# Altium schematic sheet U_Interfaces_Connectors.SchDoc
size A4; SheetNumber: 7; SheetTotal: 9
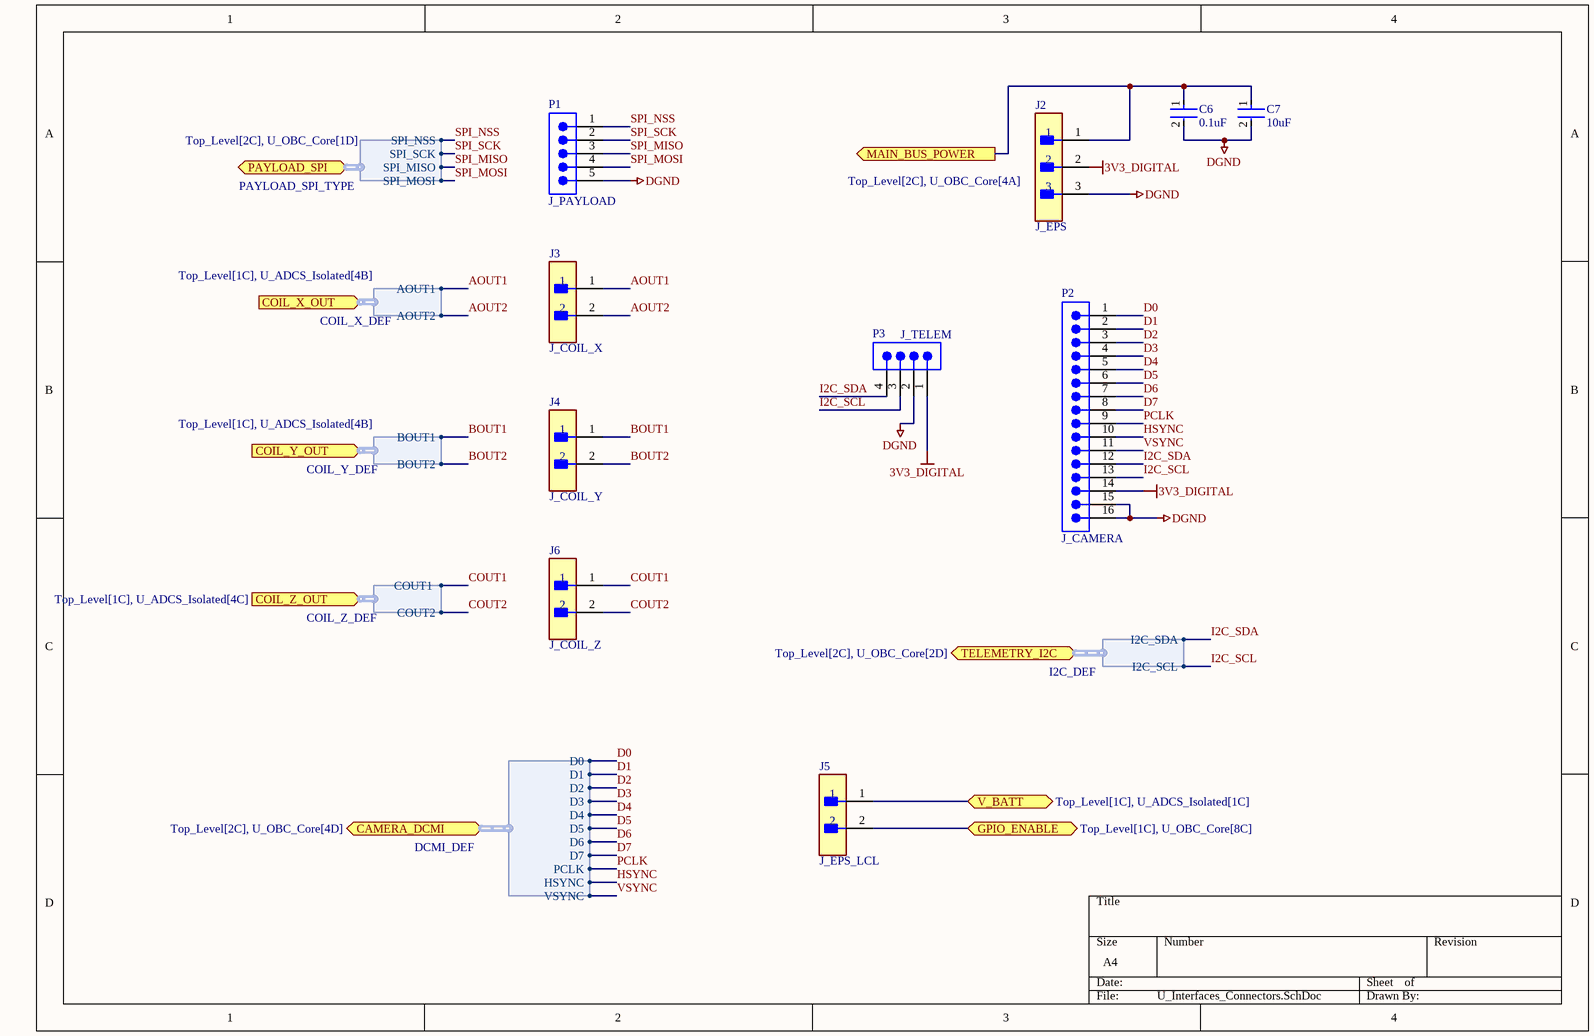
[diagram p0: U_Interfaces_Connectors.SchDoc]

## Parts
C6  0.1uF  [FP-CC0603-DA-MFG]
C7  10uF  [FP-CC0805-0_2-1_45-IPC_A]
J2  J_EPS  [FP-TSW-103-22-G-S-MFG]
J3  J_COIL_X  [FP-TSW-102-22-G-S-MFG]
J4  J_COIL_Y  [FP-TSW-102-22-G-S-MFG]
J5  J_EPS_LCL  [FP-TSW-102-22-G-S-MFG]
J6  J_COIL_Z  [FP-TSW-102-22-G-S-MFG]
P1  J_PAYLOAD  [SMTC-TSW-105-05-X-S]
P2  J_CAMERA  [SMTC-MTLW-116-07-X-S-265]
P3  J_TELEM  [SMTC-TSW-104-08-X-S]

## Ports
CAMERA_DCMI (bidir, harness DCMI_DEF, see Top_Level[2C], U_OBC_Core[4D]), COIL_X_OUT (in, harness COIL_X_DEF, see Top_Level[1C], U_ADCS_Isolated[4B]), COIL_Y_OUT (in, harness COIL_Y_DEF, see Top_Level[1C], U_ADCS_Isolated[4B]), COIL_Z_OUT (in, harness COIL_Z_DEF, see Top_Level[1C], U_ADCS_Isolated[4C]), GPIO_ENABLE (bidir, see Top_Level[1C], U_OBC_Core[8C]), MAIN_BUS_POWER (out, see Top_Level[2C], U_OBC_Core[4A]), PAYLOAD_SPI (bidir, harness PAYLOAD_SPI_TYPE, see Top_Level[2C], U_OBC_Core[1D]), TELEMETRY_I2C (bidir, harness I2C_DEF, see Top_Level[2C], U_OBC_Core[2D]), V_BATT (bidir, see Top_Level[1C], U_ADCS_Isolated[1C])

## Harnesses
PAYLOAD_SPI_TYPE: SPI_NSS, SPI_SCK, SPI_MISO, SPI_MOSI
COIL_X_DEF: AOUT1, AOUT2
I2C_DEF: I2C_SDA, I2C_SCL
COIL_Y_DEF: BOUT1, BOUT2
DCMI_DEF: D0, D1, D2, D3, D4, D5, D6, D7, PCLK, HSYNC, VSYNC
COIL_Z_DEF: COUT1 , COUT2

## Nets
3V3_DIGITAL: J2.2 P2.14 P3.1
DGND: C6.2 C7.2 J2.3 P1.5 P2.15 P2.16 P3.2
AOUT1: J3.1 ; port COIL_X_OUT.AOUT1
AOUT2: J3.2 ; port COIL_X_OUT.AOUT2
BOUT1: J4.1 ; port COIL_Y_OUT.BOUT1
BOUT2: J4.2 ; port COIL_Y_OUT.BOUT2
COUT1: J6.1 ; port COIL_Z_OUT.COUT1   [also labelled COUT1 ]
COUT2: J6.2 ; port COIL_Z_OUT.COUT2
D0: P2.1 ; port CAMERA_DCMI.D0
D1: P2.2 ; port CAMERA_DCMI.D1
D2: P2.3 ; port CAMERA_DCMI.D2
D3: P2.4 ; port CAMERA_DCMI.D3
D4: P2.5 ; port CAMERA_DCMI.D4
D5: P2.6 ; port CAMERA_DCMI.D5
D6: P2.7 ; port CAMERA_DCMI.D6
D7: P2.8 ; port CAMERA_DCMI.D7
GPIO_ENABLE: J5.2 ; port GPIO_ENABLE
HSYNC: P2.10 ; port CAMERA_DCMI.HSYNC
I2C_SCL: P2.13 P3.3 ; port TELEMETRY_I2C.I2C_SCL
I2C_SDA: P2.12 P3.4 ; port TELEMETRY_I2C.I2C_SDA
MAIN_BUS_POWER: C6.1 C7.1 J2.1 ; port MAIN_BUS_POWER
PCLK: P2.9 ; port CAMERA_DCMI.PCLK
SPI_MISO: P1.3 ; port PAYLOAD_SPI.SPI_MISO
SPI_MOSI: P1.4 ; port PAYLOAD_SPI.SPI_MOSI
SPI_NSS: P1.1 ; port PAYLOAD_SPI.SPI_NSS
SPI_SCK: P1.2 ; port PAYLOAD_SPI.SPI_SCK
V_BATT: J5.1 ; port V_BATT
VSYNC: P2.11 ; port CAMERA_DCMI.VSYNC

## Library data of the parts
C6 = CMP-2100-03601-2: CAP CER 0.1UF 50V X7R 0603; Manufacturer: YAGEO; Manufacturer Part Number: CC0603KRX7R9BB104; Material: Ceramic; Capacitance: 100 nF; Temperature Coefficient: 15%; Tolerance: 0.1; Value: 100 nF; Height: 0.9mm; Voltage: 50 V; ComponentLink2Description: Datasheet; Device Class L2: Capacitors; Temperature Range High: +125°C; Category: Cap; Footprint Url: http://www.yageo.com/exep/pages/download/literatures/UPY-C_GEN_24.pdf; ComponentLink2URL: http://www.yageo.com/documents/recent/UPY-GPHC_X7R_6.3V-to-50V_18.pdf; Package: CC0603-DA; Temperature: -55°C to +125°C; Voltage Rating: 50 V; Temperature Characteristic: X7R; Device Class L1: Passive Components; Temperature Range Low: -55°C; RoHS: TRUE; Automotive: No; Device Class L3: Ceramic Capacitors; Octopart: https://octopart.com/cc0603krx7r9bb104-yageo-42244635; Mouser Description: Multilayer Ceramic Capacitor, CC Series, 0.1 - F, - 10%, X7R, 50 V, 0603 [1608 Metric]; Lead Free: Yes; Digikey Description: CAP CER 0.1UF 50V X7R 0603
C7 = CMP-1036-04922-3: CAP CER 10UF 10V X5R 0805; Tolerance: 10%; Dissipation Factor: 15%; Voltage Rating: 10V; Case/Package: 0805; Series: CC; Package Quantity: 1; Max Operating Temperature: 85°C; Min Operating Temperature: -55°C; Radiation Hardening: No; Termination: SMD/SMT; Voltage Rating (DC): 10V; Width: 0.049inch; Height: 0.85mm; Packaging: Tape and Reel; Voltage: 10V; Halogen Free: Halogen Free; Lead Free: Lead Free; Case Code (Imperial): 0805; Resistor Type: Ceramic; Length: 2mm; Construction: Flat; Mount: Surface Mount; Capacitance: 10uF; Depth: 1.25mm; Number of Pins: 2; Dielectric: X5R; RoHS Compliant: Yes; Case Code (Metric): 2012
J2 = CMP-02766-000544-1: Conn Unshrouded Header HDR 3 POS 2.54mm Solder ST Thru-Hole Bulk; Max Current Rating: 7.6A; Gender: Male; Max Voltage Rating (AC): 550V; Number of Contacts: 3; Orientation: Straight; REACH SVHC: No SVHC; Pitch: 2.54mm; Termination: Solder; Length: 7.62mm; Contact Material: Bronze; Housing Color: Black; Housing Material: Polyester; Number of Rows: 1; Contact Plating: Gold; Min Operating Temperature: -55°C; Packaging: Bulk; Depth: 2.54mm; Max Operating Temperature: 125°C
J3-J6 = CMP-02766-000117-1: CONN HEADER VERT 2POS 2.54MM; Max Voltage Rating (AC): 550V; Gender: Male; Max Current Rating: 7.6A; Number of Contacts: 2; Housing Color: Black; Max Operating Temperature: 125°C; Orientation: Straight; Depth: 2.54mm; Pitch: 2.54mm; Housing Material: Polyester; Packaging: Bulk; Termination: Solder; Contact Plating: Gold; Length: 5.08mm; Number of Rows: 1; Radiation Hardening: No; Min Operating Temperature: -55°C; REACH SVHC: No SVHC; Contact Material: Bronze
P1 = CMP-1024-00366-1: 0.025" SQ Post Header, Through-hole, Vertical, -55 to 125 degC, 2.54 mm Pitch, 5-Pin, Male, RoHS; PartNumber: TSW-105-05-L-S; Manufacturer: Samtec; Pitch: 2.54 mm; PackageVersion: DM, 8/1988; Orientation: Vertical; Temperature Range: -55 to 125 degC; ComponentLink1Description: Manufacturer URL; PackageDescription: .025[0.64] SQ. Post Terminal Strip Assembly; ComponentLink2URL: http://www.samtec.com/documents/webfiles/pdf/TSW_TH.PDF; PackageReference: TSW-105-05-X-S; ComponentLink2Description: Datasheet; Mounting Technology: Through-hole; DatasheetVersion: F-214; ComponentLink1URL: http://www.samtec.com; RoHS: True; ComponentLink3URL: http://www.samtec.com/documents/webfiles/cpdf/TSW-XXX-XX-XXX-X-XX-XXX-MKT.pdf; ComponentLink3Description: Package Specification
P2 = CMP-1024-00092-1: Low Profile .025" SQ Post Header, Through-hole, Vertical, -55 to 125 degC, 2.54 mm Pitch, 16-Pin, Male, RoHS; Manufacturer: Samtec; PartNumber: MTLW-116-07-G-S-265; Pitch: 2.54 mm; Orientation: Vertical; RoHS: True; ComponentLink2URL: http://www.samtec.com/documents/webfiles/pdf/MTLW_TH.PDF; ComponentLink1URL: http://www.samtec.com; ComponentLink3URL: http://www.samtec.com/documents/webfiles/cpdf/MTLW-1XX-XX-XX-X-XXX-XX-XX-MKT1.pdf; PackageVersion: T, 6/1991; Temperature Range: -55 to 125 degC; Mounting Technology: Through-hole; ComponentLink3Description: Package Specification; ComponentLink1Description: Manufacturer URL; ComponentLink2Description: Datasheet; PackageDescription: Low Profile Terminal Assembly; DatasheetVersion: F-214; PackageReference: MTLW-116-07-X-S-265
P3 = CMP-1024-00358-1: 0.025" SQ Post Header, Through-hole, Vertical, -55 to 125 degC, 2.54 mm Pitch, 4-Pin, Male, RoHS; PartNumber: TSW-104-08-L-S; Manufacturer: Samtec; Pitch: 2.54 mm; RoHS: True; Temperature Range: -55 to 125 degC; PackageDescription: .025[0.64] SQ. Post Terminal Strip Assembly; Orientation: Vertical; ComponentLink2URL: http://www.samtec.com/documents/webfiles/pdf/TSW_TH.PDF; ComponentLink1Description: Manufacturer URL; ComponentLink2Description: Datasheet; PackageVersion: DM, 8/1988; ComponentLink3URL: http://www.samtec.com/documents/webfiles/cpdf/TSW-XXX-XX-XXX-X-XX-XXX-MKT.pdf; Mounting Technology: Through-hole; PackageReference: TSW-104-08-X-S; ComponentLink3Description: Package Specification; ComponentLink1URL: http://www.samtec.com; DatasheetVersion: F-214